# EAGLE design macropad_B (EAGLE 7.7.0)
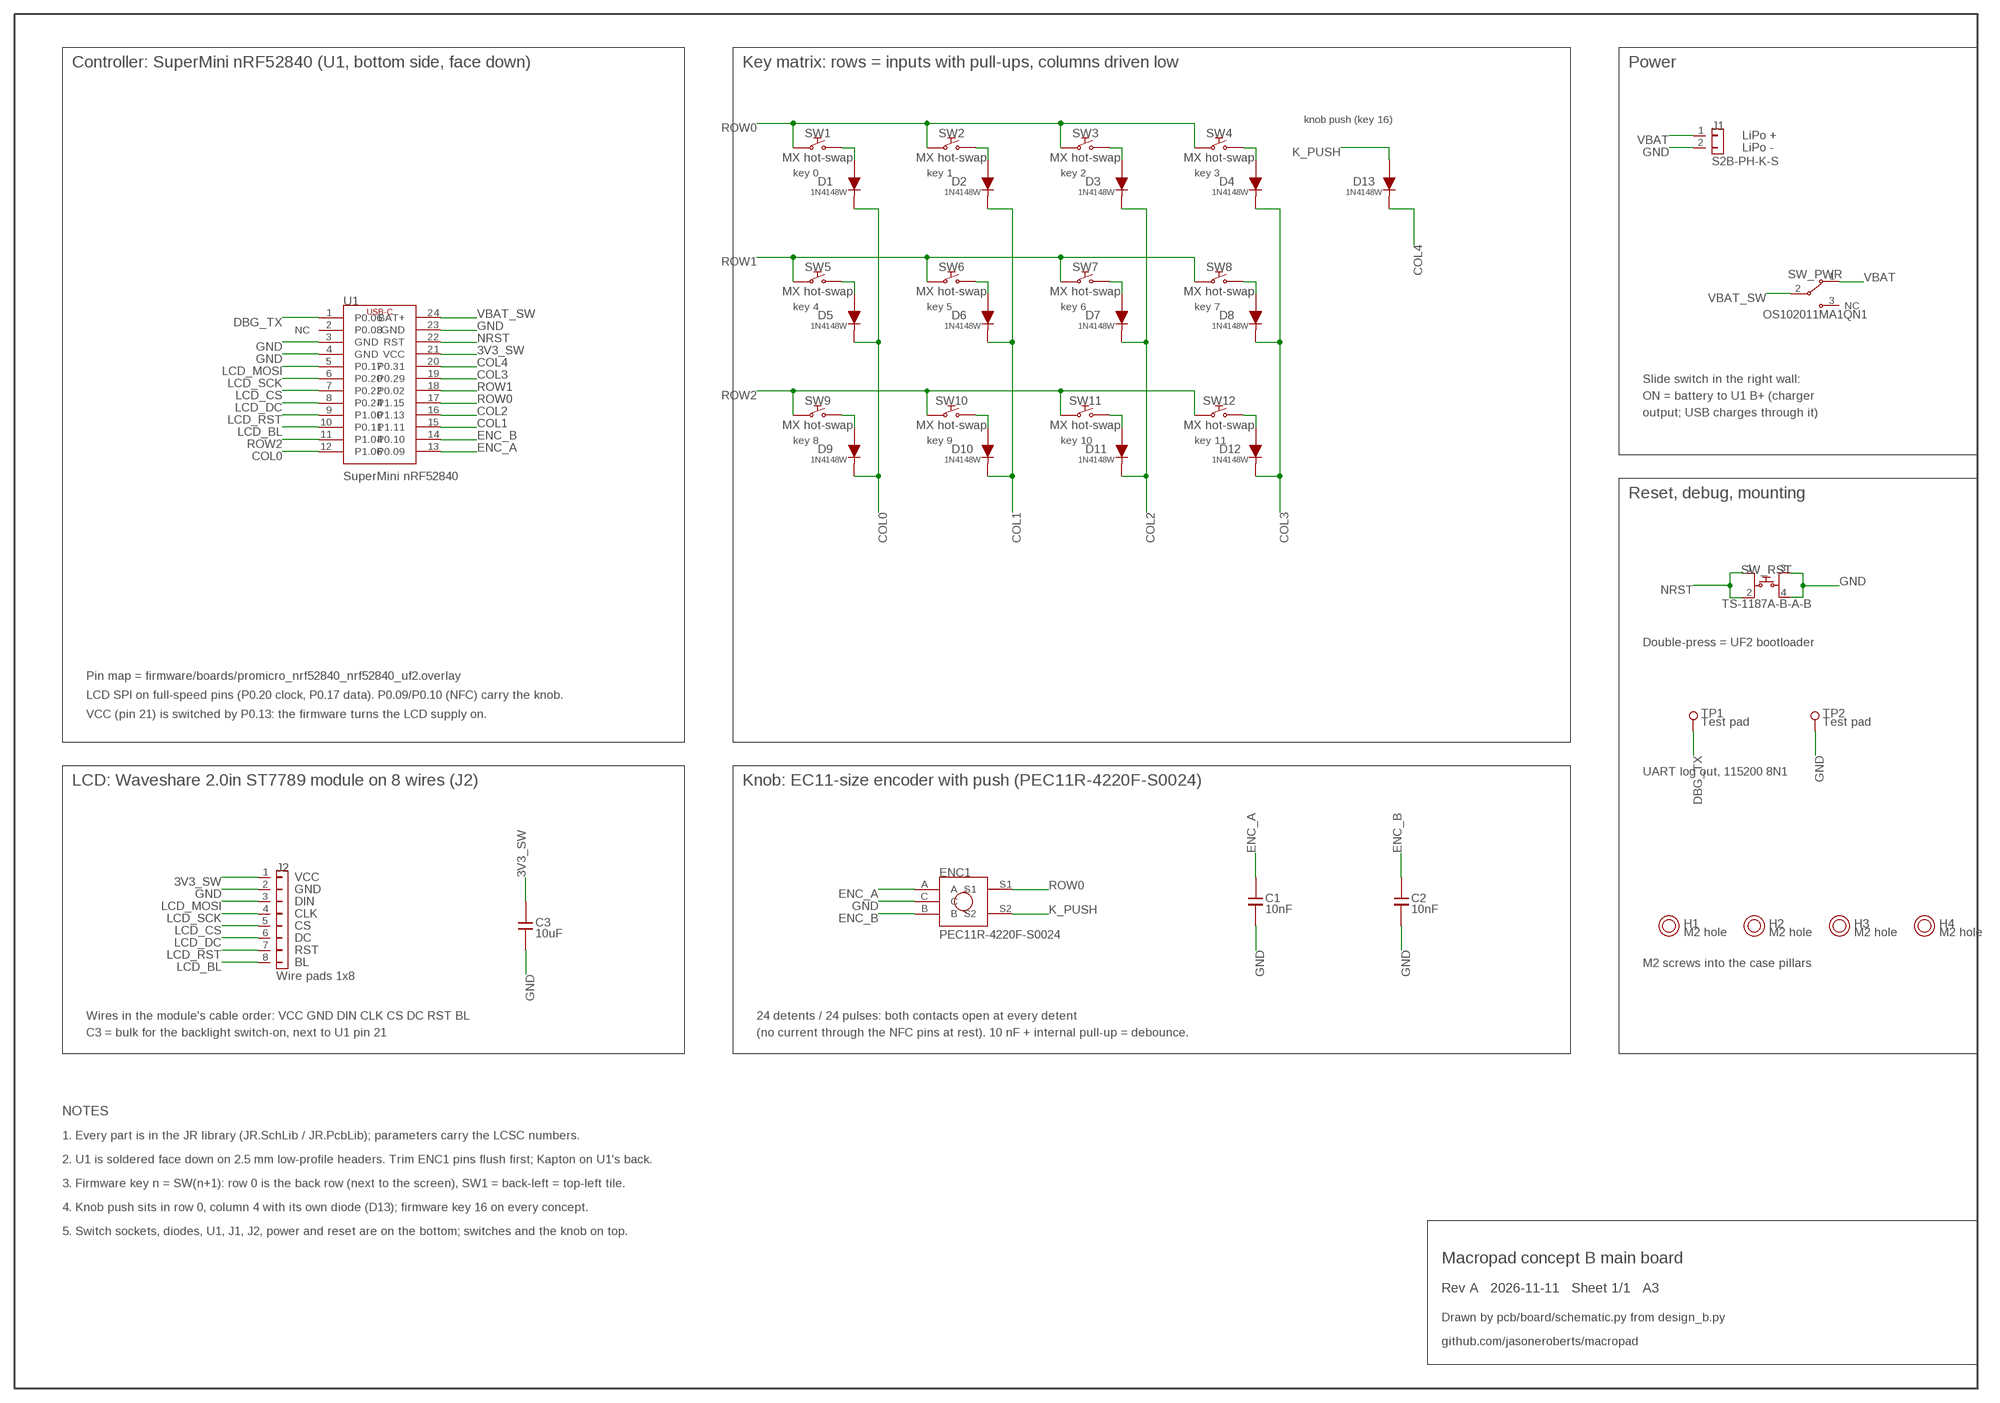
[diagram p0: schematic, sheet 1]

## Parts
C1  10nF  C_10n_0805  [C_0805_2012Metric]
C2  10nF  C_10n_0805  [C_0805_2012Metric]
C3  10uF  C_10u_0805  [C_0805_2012Metric]
D1  1N4148W  D_1N4148W_SOD-123  [D_SOD-123]
D2  1N4148W  D_1N4148W_SOD-123  [D_SOD-123]
D3  1N4148W  D_1N4148W_SOD-123  [D_SOD-123]
D4  1N4148W  D_1N4148W_SOD-123  [D_SOD-123]
D5  1N4148W  D_1N4148W_SOD-123  [D_SOD-123]
D6  1N4148W  D_1N4148W_SOD-123  [D_SOD-123]
D7  1N4148W  D_1N4148W_SOD-123  [D_SOD-123]
D8  1N4148W  D_1N4148W_SOD-123  [D_SOD-123]
D9  1N4148W  D_1N4148W_SOD-123  [D_SOD-123]
D10  1N4148W  D_1N4148W_SOD-123  [D_SOD-123]
D11  1N4148W  D_1N4148W_SOD-123  [D_SOD-123]
D12  1N4148W  D_1N4148W_SOD-123  [D_SOD-123]
D13  1N4148W  D_1N4148W_SOD-123  [D_SOD-123]
ENC1  PEC11R-4220F-S0024  Encoder_PEC11R-4220F-S0024  [RotaryEncoder_EC11_Switch_NPTH]
H1  M2 hole  MountingHole_M2  [MountingHole_2.2mm_M2]
H2  M2 hole  MountingHole_M2  [MountingHole_2.2mm_M2]
H3  M2 hole  MountingHole_M2  [MountingHole_2.2mm_M2]
H4  M2 hole  MountingHole_M2  [MountingHole_2.2mm_M2]
J1  S2B-PH-K-S  Conn_JST_PH_S2B_Horizontal  [JST_PH_S2B-PH-K_1x02_P2.00mm_Horizontal]
J2  Wire pads 1x8  Conn_Wire_Pads_1x08  [PinHeader_1x08_P2.54mm_Vertical]
SW1  MX hot-swap  SW_Kailh_MX_Hotswap  [SW_Kailh_MX_Hotswap]
SW2  MX hot-swap  SW_Kailh_MX_Hotswap  [SW_Kailh_MX_Hotswap]
SW3  MX hot-swap  SW_Kailh_MX_Hotswap  [SW_Kailh_MX_Hotswap]
SW4  MX hot-swap  SW_Kailh_MX_Hotswap  [SW_Kailh_MX_Hotswap]
SW5  MX hot-swap  SW_Kailh_MX_Hotswap  [SW_Kailh_MX_Hotswap]
SW6  MX hot-swap  SW_Kailh_MX_Hotswap  [SW_Kailh_MX_Hotswap]
SW7  MX hot-swap  SW_Kailh_MX_Hotswap  [SW_Kailh_MX_Hotswap]
SW8  MX hot-swap  SW_Kailh_MX_Hotswap  [SW_Kailh_MX_Hotswap]
SW9  MX hot-swap  SW_Kailh_MX_Hotswap  [SW_Kailh_MX_Hotswap]
SW10  MX hot-swap  SW_Kailh_MX_Hotswap  [SW_Kailh_MX_Hotswap]
SW11  MX hot-swap  SW_Kailh_MX_Hotswap  [SW_Kailh_MX_Hotswap]
SW12  MX hot-swap  SW_Kailh_MX_Hotswap  [SW_Kailh_MX_Hotswap]
SW_PWR  OS102011MA1QN1  SW_Slide_OS102011MA1QN1  [SW_Slide_SPDT_Angled_CK_OS102011MA1Q]
SW_RST  TS-1187A-B-A-B  SW_Tact_TS-1187A-B-A-B  [SW_Push_1P1T_XKB_TS-1187A]
TP1  Test pad  TestPoint_Pad_1.5mm  [TestPoint_Pad_D1.5mm]
TP2  Test pad  TestPoint_Pad_1.5mm  [TestPoint_Pad_D1.5mm]
U1  SuperMini nRF52840  SuperMini_nRF52840  [SuperMini_nRF52840]

## Nets
3V3_SW [power]: C3.1 J2.1 U1.21(VCC)
COL0: D1.1(K) D5.1(K) D9.1(K) U1.12(P1.06)
COL1: D2.1(K) D6.1(K) D10.1(K) U1.15(P1.11)
COL2: D3.1(K) D7.1(K) D11.1(K) U1.16(P1.13)
COL3: D4.1(K) D8.1(K) D12.1(K) U1.19(P0.29)
COL4: D13.1(K) U1.20(P0.31)
DBG_TX: TP1.1 U1.1(P0.06)
ENC_A: C1.1 ENC1.A U1.13(P0.09)
ENC_B: C2.1 ENC1.B U1.14(P0.10)
GND [power]: C1.2 C2.2 C3.2 ENC1.C J1.2 J2.2 SW_RST.3 SW_RST.4 TP2.1 U1.3(GND) U1.4(GND) U1.23(GND)
K1: D1.2(A) SW1.2
K2: D2.2(A) SW2.2
K3: D3.2(A) SW3.2
K4: D4.2(A) SW4.2
K5: D5.2(A) SW5.2
K6: D6.2(A) SW6.2
K7: D7.2(A) SW7.2
K8: D8.2(A) SW8.2
K9: D9.2(A) SW9.2
K10: D10.2(A) SW10.2
K11: D11.2(A) SW11.2
K12: D12.2(A) SW12.2
K_PUSH: D13.2(A) ENC1.S2
LCD_BL: J2.8 U1.10(P0.11)
LCD_CS: J2.5 U1.7(P0.22)
LCD_DC: J2.6 U1.8(P0.24)
LCD_MOSI: J2.3 U1.5(P0.17)
LCD_RST: J2.7 U1.9(P1.00)
LCD_SCK: J2.4 U1.6(P0.20)
NRST: SW_RST.1 SW_RST.2 U1.22(RST)
ROW0: ENC1.S1 SW1.1 SW2.1 SW3.1 SW4.1 U1.17(P1.15)
ROW1: SW5.1 SW6.1 SW7.1 SW8.1 U1.18(P0.02)
ROW2: SW9.1 SW10.1 SW11.1 SW12.1 U1.11(P1.04)
VBAT [power]: J1.1 SW_PWR.1
VBAT_SW [power]: SW_PWR.2(COM) U1.24(BAT+)
Unconnected: SW_PWR.3 U1.2(P0.08)

## Notes on the sheet
- Controller: SuperMini nRF52840 (U1, bottom side, face down) | Key matrix: rows = inputs with pull-ups, columns driven low | Power
- knob push (key 16)
- LiPo +
- LiPo -
- key 0 | key 1 | key 2 | key 3
- key 4 | key 5 | key 6 | key 7 | NC
- NC
- Slide switch in the right wall:
- ON = battery to U1 B+ (charger
- output; USB charges through it)
- key 8 | key 9 | key 10 | key 11
- Reset, debug, mounting
- Double-press = UF2 bootloader
- Pin map = firmware/boards/promicro_nrf52840_nrf52840_uf2.overlay
- LCD SPI on full-speed pins (P0.20 clock, P0.17 data). P0.09/P0.10 (NFC) carry the knob.
- VCC (pin 21) is switched by P0.13: the firmware turns the LCD supply on.
- UART log out, 115200 8N1
- LCD: Waveshare 2.0in ST7789 module on 8 wires (J2) | Knob: EC11-size encoder with push (PEC11R-4220F-S0024)
- VCC
- GND
- DIN
- CLK
- CS
- DC
- RST
- BL | M2 screws into the case pillars
- Wires in the module's cable order: VCC GND DIN CLK CS DC RST BL | 24 detents / 24 pulses: both contacts open at every detent
- C3 = bulk for the backlight switch-on, next to U1 pin 21 | (no current through the NFC pins at rest). 10 nF + internal pull-up = debounce.
- NOTES
- 1. Every part is in the JR library (JR.SchLib / JR.PcbLib); parameters carry the LCSC numbers.
- 2. U1 is soldered face down on 2.5 mm low-profile headers. Trim ENC1 pins flush first; Kapton on U1's back.
- 3. Firmware key n = SW(n+1): row 0 is the back row (next to the screen), SW1 = back-left = top-left tile.
- 4. Knob push sits in row 0, column 4 with its own diode (D13); firmware key 16 on every concept.
- 5. Switch sockets, diodes, U1, J1, J2, power and reset are on the bottom; switches and the knob on top.
- Macropad concept B main board
- Rev A   2026-11-11   Sheet 1/1   A3
- Drawn by pcb/board/schematic.py from design_b.py
- github.com/jasoneroberts/macropad

## Library data of the parts
C1 C2 = JR:C_10n_0805: Capacitor 10 nF 50 V X7R 0805; DESCRIPTION: Capacitor 10 nF 50 V X7R 0805; LCSC: C1710; MANUFACTURER: Samsung; MPN: CL21B103KBANNNC
C3 = JR:C_10u_0805: Capacitor 10 uF 25 V X5R 0805; DESCRIPTION: Capacitor 10 uF 25 V X5R 0805; LCSC: C15850; MANUFACTURER: Samsung; MPN: CL21A106KAYNNNE
D1-D13 = JR:D_1N4148W_SOD-123: Switching diode 100 V 150 mA, SOD-123; DESCRIPTION: Switching diode 100 V 150 mA, SOD-123; LCSC: C81598; MANUFACTURER: ST(Semtech); MPN: 1N4148W
ENC1 = JR:Encoder_PEC11R-4220F-S0024: Rotary encoder, 24 detents / 24 pulses, push switch, 20 mm flatted shaft, EC11 size; DESCRIPTION: Rotary encoder, 24 detents / 24 pulses, push switch, 20 mm flatted shaft, EC11 size; LCSC: C143797; MANUFACTURER: Bourns; MPN: PEC11R-4220F-S0024
H1-H4 = JR:MountingHole_M2: Unplated 2.2 mm hole for an M2 screw; DESCRIPTION: Unplated 2.2 mm hole for an M2 screw
J1 = JR:Conn_JST_PH_S2B_Horizontal: JST PH 2-pin header, side entry, through-hole (LiPo plug); DESCRIPTION: JST PH 2-pin header, side entry, through-hole (LiPo plug); LCSC: C173752; MANUFACTURER: JST; MPN: S2B-PH-K-S(LF)(SN)
J2 = JR:Conn_Wire_Pads_1x08: 8 plated holes, 2.54 mm, 1.0 mm drill: solder wires (or a 1x8 header); DESCRIPTION: 8 plated holes, 2.54 mm, 1.0 mm drill: solder wires (or a 1x8 header)
SW1-SW12 = JR:SW_Kailh_MX_Hotswap: Kailh MX hot-swap socket for MX switches. Footprint goes on the bottom layer; DESCRIPTION: Kailh MX hot-swap socket for MX switches. Footprint goes on the bottom layer; LCSC: C2803348; MANUFACTURER: Kailh; MPN: CPG151101S11
SW_PWR = JR:SW_Slide_OS102011MA1QN1: Slide switch SPDT, right angle, through-hole, 4 mm actuator; DESCRIPTION: Slide switch SPDT, right angle, through-hole, 4 mm actuator; LCSC: C226259; MANUFACTURER: C&K; MPN: OS102011MA1QN1
SW_RST = JR:SW_Tact_TS-1187A-B-A-B: Tactile switch 5.1 x 5.1 x 1.5 mm, SMD gull-wing, 160 gf; DESCRIPTION: Tactile switch 5.1 x 5.1 x 1.5 mm, SMD gull-wing, 160 gf; LCSC: C318884; MANUFACTURER: XKB Connection; MPN: TS-1187A-B-A-B
TP1 TP2 = JR:TestPoint_Pad_1.5mm: Test pad, 1.5 mm, no part fitted; DESCRIPTION: Test pad, 1.5 mm, no part fitted
U1 = JR:SuperMini_nRF52840: nRF52840 module, nice!nano v2 pinout, LiPo charger, USB-C. Pro Micro 24-pin; DESCRIPTION: nRF52840 module, nice!nano v2 pinout, LiPo charger, USB-C. Pro Micro 24-pin; MANUFACTURER: generic (nice!nano v2 clone); MPN: SuperMini nRF52840

## Net classes
0 default: width 0.25 mm, drill 0.3 mm, clearance 0.2 mm
1 power: width 0.4 mm, drill 0.3 mm, clearance 0.2 mm

## Board
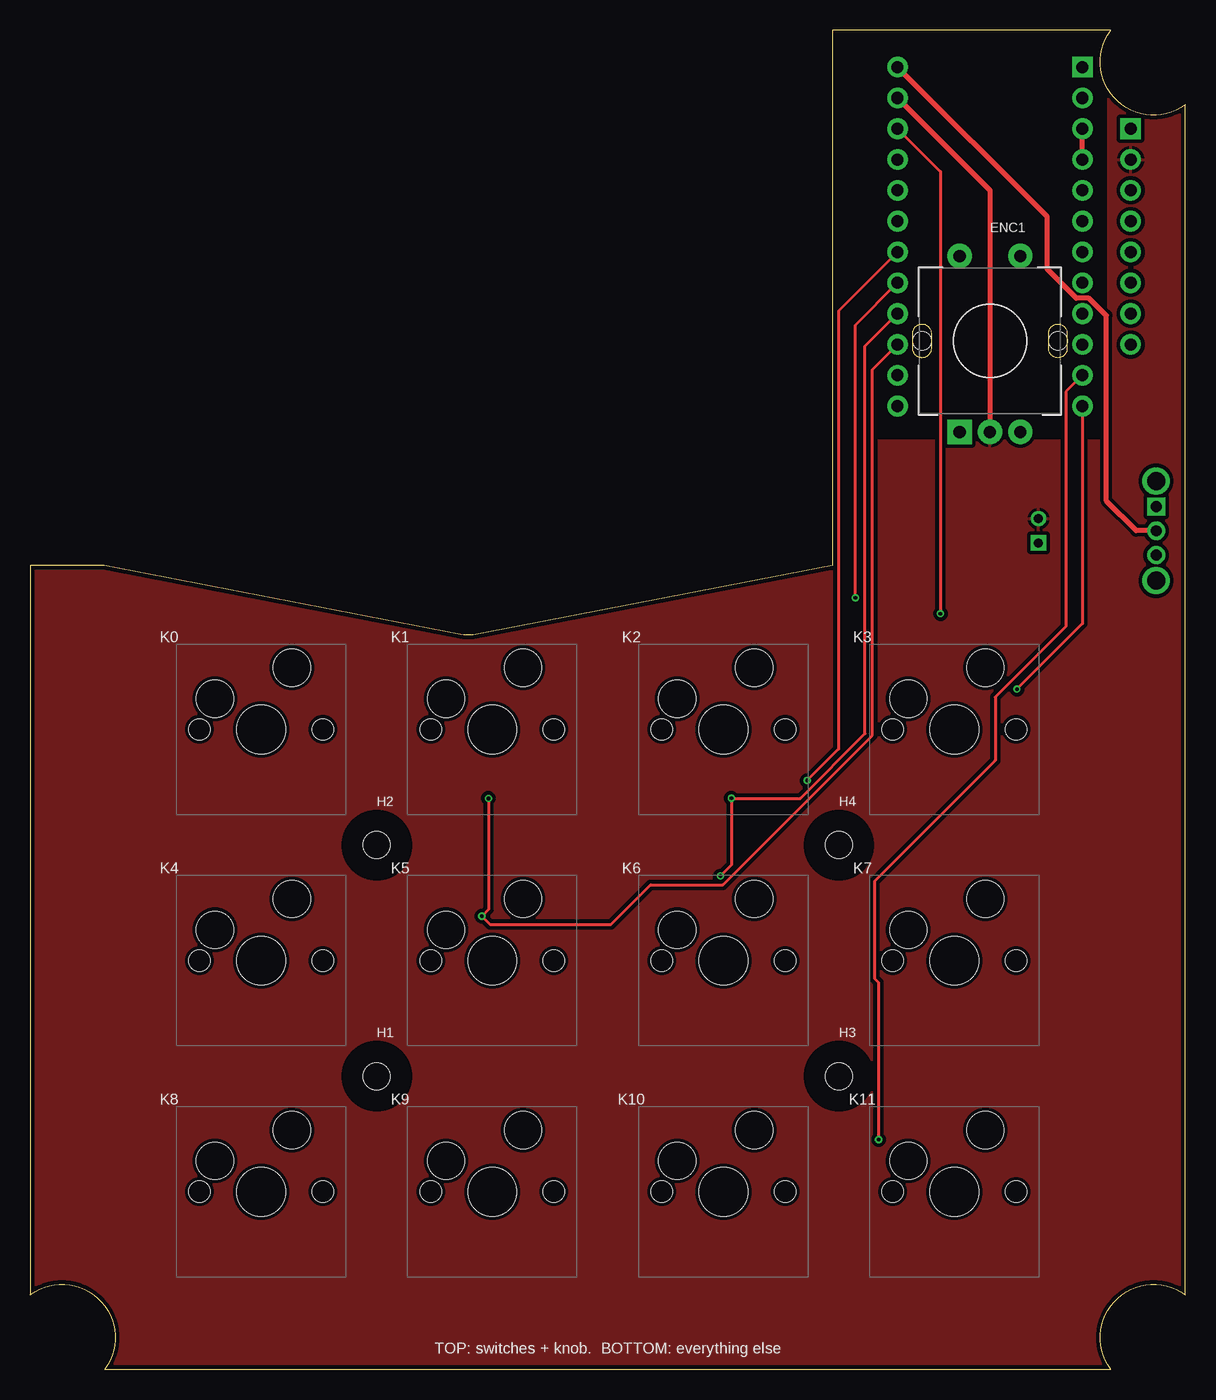
[diagram p1: board, top side]
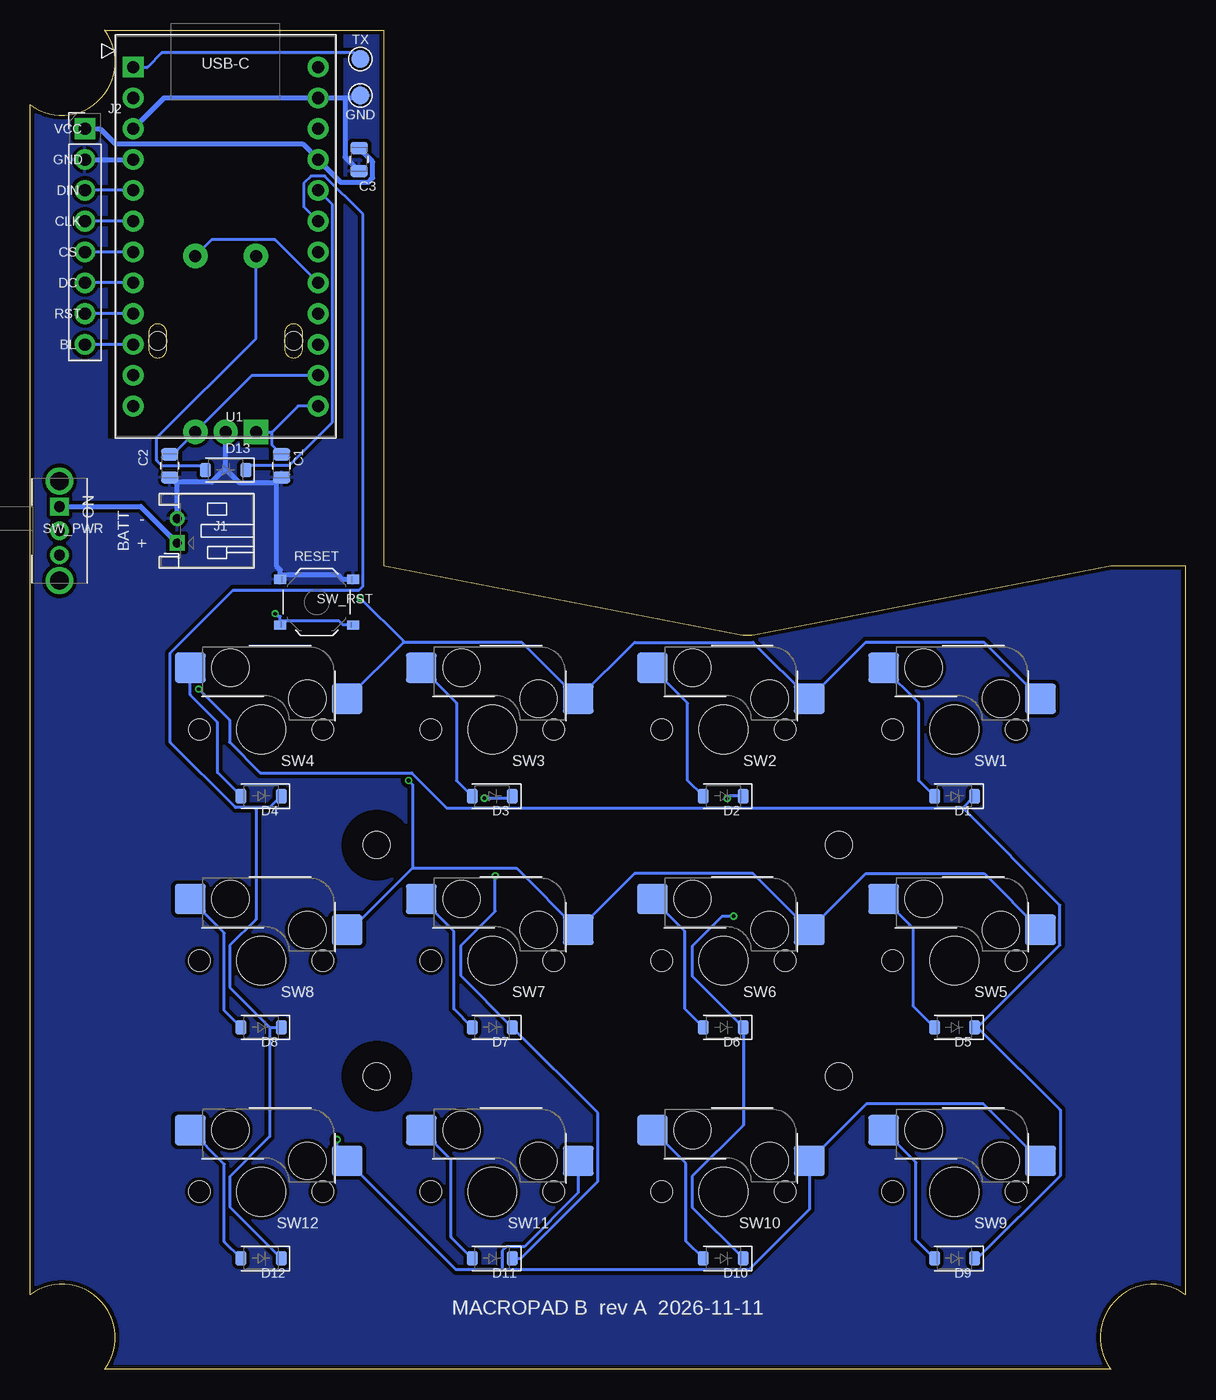
[diagram p2: board, bottom side, seen from below]

Size 95.2 x 110.35 mm. Coordinates in mm from the lower left corner, seen from the top.
Outline: 89.05,110.35 66.1,110.35 66.1,66.25 36.72,60.56 arc-22 35.48,60.56 6.1,66.25 0,66.25 0,6.15 arc-162 6.15,0 89.05,0 arc-162 95.2,6.15 95.2,104.2 arc-162 89.05,110.35
Copper layers (1*16): Top / Bottom
Design rules "macropad": minimum track width 0.2mm, minimum drill 0.3mm, track to track 0.2mm, track to pad 0.2mm, pad to pad 0.2mm, via to via 0.2mm, copper to edge 0.3mm, drill to drill 0.25mm, minimum via ring 0.15mm
tRestrict: area 26.7,22.3 to 30.5,26.1; area 26.7,41.3 to 30.5,45.1; area 64.7,22.3 to 68.5,26.1; area 64.7,41.3 to 68.5,45.1
bRestrict: area 26.7,22.3 to 30.5,26.1; area 26.7,41.3 to 30.5,45.1; area 64.7,22.3 to 68.5,26.1; area 64.7,41.3 to 68.5,45.1

### Footprints (pad centres in the part's own frame; a part is rotated, then mirrored left to right if it is on the bottom)
C_0805_2012Metric = smd 1 x 1.45: 1 -0.95,0; 2 0.95,0
D_SOD-123 = smd 0.9 x 1.2: 1 -1.65,0; 2 1.65,0
RotaryEncoder_EC11_Switch_NPTH = drill 1 pad 2 square: A -7.5,2.5 | drill 1 pad 2 round: B -7.5,-2.5; C -7.5,0; S1 7,-2.5; S2 7,2.5 | hole 1.5: 0,5.6; 0,-5.6
MountingHole_2.2mm_M2 = hole 2.2: 0,0
JST_PH_S2B-PH-K_1x02_P2.00mm_Horizontal = drill 0.75 pad 1.2 square: 1 0,0 | drill 0.75 pad 1.2 round: 2 2,0
PinHeader_1x08_P2.54mm_Vertical = drill 1 pad 1.7 square: 1 0,0 | drill 1 pad 1.7 round: 2 0,-2.54; 3 0,-5.08; 4 0,-7.62; 5 0,-10.16; 6 0,-12.7; 7 0,-15.24; 8 0,-17.78
SW_Kailh_MX_Hotswap = smd 2.55 x 2.5: 1 7.085,2.54; 2 -5.842,5.08 | hole 4: 0,0 | hole 1.75: -5.08,0; 5.08,0 | hole 3.05: 3.81,2.54; -2.54,5.08
SW_Slide_SPDT_Angled_CK_OS102011MA1Q = drill 0.9 pad 1.5 square: 1 0,0 | drill 0.9 pad 1.5 round: 2 2,0; 3 4,0 | drill 1.5 pad 2.2 round: MP1 -2.1,0; MP2 6.1,0
SW_Push_1P1T_XKB_TS-1187A = smd 1 x 0.75: 1 -3,1.875; 2 3,1.875; 3 -3,-1.875; 4 3,-1.875
TestPoint_Pad_D1.5mm = smd 1.5 x 1.5: 1 0,0
SuperMini_nRF52840 = drill 1 pad 1.7 square: 1 -7.62,13.97 | drill 1 pad 1.7 round: 2 -7.62,11.43; 3 -7.62,8.89; 4 -7.62,6.35; 5 -7.62,3.81; 6 -7.62,1.27; 7 -7.62,-1.27; 8 -7.62,-3.81; 9 -7.62,-6.35; 10 -7.62,-8.89; 11 -7.62,-11.43; 12 -7.62,-13.97; 13 7.62,-13.97; 14 7.62,-11.43; 15 7.62,-8.89; 16 7.62,-6.35; 17 7.62,-3.81; 18 7.62,-1.27; 19 7.62,1.27; 20 7.62,3.81; 21 7.62,6.35; 22 7.62,8.89; 23 7.62,11.43; 24 7.62,13.97

### Placement (x,y rotation side)
C1  74.5,74.45 270 bottom
C2  83.7,74.45 270 bottom
C3  68.1,99.7 270 bottom
D1  19.03,47.23 180 bottom
D2  38.08,47.23 180 bottom
D3  57.12,47.23 180 bottom
D4  76.17,47.23 180 bottom
D5  19.03,28.18 180 bottom
D6  38.08,28.18 180 bottom
D7  57.12,28.18 180 bottom
D8  76.17,28.18 180 bottom
D9  19.03,9.12 180 bottom
D10  38.08,9.12 180 bottom
D11  57.12,9.12 180 bottom
D12  76.17,9.12 180 bottom
D13  79.1,74.1 180 bottom
ENC1  79.1,84.75 90 top
H1  28.55,24.15 0 top
H2  28.55,43.2 0 top
H3  66.65,24.15 0 top
H4  66.65,43.2 0 top
J1  83.1,68.1 90 bottom
J2  90.7,102.24 0 bottom
SW1  19.03,52.73 0 bottom
SW2  38.08,52.73 0 bottom
SW3  57.12,52.73 0 bottom
SW4  76.17,52.73 0 bottom
SW5  19.03,33.68 0 bottom
SW6  38.08,33.68 0 bottom
SW7  57.12,33.68 0 bottom
SW8  76.17,33.68 0 bottom
SW9  19.03,14.62 0 bottom
SW10  38.08,14.62 0 bottom
SW11  57.12,14.62 0 bottom
SW12  76.17,14.62 0 bottom
SW_PWR  92.8,71.1 270 bottom
SW_RST  71.6,63.23 180 bottom
TP1  68,108 0 bottom
TP2  68,105 0 bottom
U1  79.1,93.35 0 bottom

### Tracks (layer width: path | path; a pad name or v marks a point on that pad's centre or on a via)
3V3_SW
  Bottom 0.4: C3.1 66.97,99.52 66.97,98.19 67.33,97.83 69.61,97.83 U1.21 72.77,100.99 88.2,100.99 89.45,102.24 J2.1
COL0  (via drill 0.3 pad 0.6)
  Top 0.25: v81.32,56.05 86.72,61.45 U1.12
  Bottom 0.25: 18.35,46.25 10.33,38.24 10.33,34.96 17.12,28.18 | 17.12,28.18 10.31,21.36 10.31,15.94 17.12,9.12 D9.1 | 18.35,46.25 60.88,46.25 63.77,49.15 76.24,49.15 78.77,51.68 78.77,53.5 v81.32,56.05 | D5.1 17.12,28.18 | 18.35,46.25 D1.1
COL1  (via drill 0.3 pad 0.6)
  Top 0.25: v37.77,47.04 37.77,37.89 v37.21,37.33 37.91,36.64 47.85,36.64 51.14,39.93 57.08,39.93 69.39,52.25 69.39,82.38 U1.15
  Bottom 0.25: v37.77,47.04 37.58,47.23 D2.1 | D10.1 40.65,13.35 40.65,15.87 36.43,20.1 D6.1 40.66,32.41 40.66,34.85 38.18,37.33 v37.21,37.33
COL2  (via drill 0.3 pad 0.6)
  Top 0.25: U1.16 68.8,84.32 68.8,52.39 63.47,47.06 v57.79,47.06 57.79,41.55 v56.88,40.65
  Bottom 0.25: v57.79,47.06 55.64,47.06 D3.1 | D11.1 54.77,9.12 48.42,15.47 48.42,21.12 D7.1 59.72,32.42 59.72,34.91 56.88,37.74 v56.88,40.65
COL3
  Bottom 0.25: 75.46,28.18 75.46,19.17 78.76,15.86 78.76,13.36 D12.1 | U1.19 72.66,95.8 72.66,97.74 72.06,98.34 70.93,98.34 67.77,95.18 67.77,64.54 68.11,64.21 78.49,64.21 83.65,59.04 83.65,51.66 78.29,46.29 76.59,46.29 | 75.46,28.18 78.76,31.48 78.76,34.91 76.59,37.09 76.59,46.29 | 75.46,28.18 D8.1 | D4.1 75.46,46.29 76.59,46.29
COL4
  Bottom 0.25: D13.1 77.01,74.54 73.81,74.54 70.29,78.06 70.29,95.97 U1.20
DBG_TX
  Bottom 0.25: TP1.1 68.5,108.5 84.37,108.5 85.54,107.32 U1.1
ENC_A
  Bottom 0.25: C1.1 75.27,76.17 75.27,77.25 | U1.13 73.14,79.38 75.27,77.25 | ENC1.A 75.27,77.25
ENC_B
  Bottom 0.25: C2.1 83.45,75.4 ENC1.B 76.93,81.92 U1.14
GND
  Top 0.4: ENC1.C 79.1,97.16 U1.23 | U1.4 U1.3
  Bottom 0.4: 79.13,74.21 80.24,73.1 83.1,73.1 | 74.92,73.08 78,73.08 79.13,74.21 | 83.1,73.1 83.1,71.1 J1.2 | 69.26,104.78 69.26,99.91 C3.2 | 74.6,65.49 69.89,65.49 69.5,65.1 SW_RST.3 | 69.26,104.78 U1.23 84.18,104.78 U1.3 | 74.6,65.49 74.6,65.88 74.92,66.2 74.92,73.08 | C2.2 83.3,73.1 83.1,73.1 | J2.2 U1.4 | 74.92,73.08 C1.2 | SW_RST.4 74.6,65.49 | TP2.1 68.22,104.78 69.26,104.78 | ENC1.C 79.13,77.22 79.13,74.21
  pour Top (isolate 0.3): 0.3,65.95 6.07,65.95 35.43,60.26 35.81,60.21 36.2,60.2 36.77,60.26 66.4,66 66.4,110.05 69.3,110.05 69.3,76.55 88.9,76.55 88.9,104.85 89.46,104.26 90.04,103.81 90.69,103.45 91.15,103.28 91.63,103.15 92.36,103.06 92.86,103.06 93.35,103.11 94.07,103.28 94.53,103.46 94.9,103.65 94.9,6.7 94.53,6.89 94.07,7.07 93.35,7.24 92.61,7.3 91.87,7.24 91.15,7.07 90.47,6.79 89.84,6.4 89.28,5.92 88.8,5.36 88.41,4.73 88.13,4.05 87.96,3.33 87.9,2.59 87.96,1.85 88.13,1.13 88.31,0.67 88.5,0.3 6.7,0.3 6.89,0.67 7.07,1.13 7.24,1.85 7.3,2.59 7.24,3.33 7.07,4.05 6.79,4.73 6.4,5.36 5.92,5.92 5.36,6.4 4.73,6.79 4.05,7.07 3.33,7.24 2.59,7.3 1.85,7.24 1.13,7.07 0.67,6.89 0.3,6.7
  pour Bottom (isolate 0.3): 0.3,65.95 6.07,65.95 35.43,60.26 35.81,60.21 36.2,60.2 36.77,60.26 66.4,66 66.4,110.05 69.3,110.05 69.3,76.55 88.9,76.55 88.9,104.85 89.46,104.26 90.04,103.81 90.69,103.45 91.15,103.28 91.63,103.15 92.36,103.06 92.86,103.06 93.35,103.11 94.07,103.28 94.53,103.46 94.9,103.65 94.9,6.7 94.53,6.89 94.07,7.07 93.35,7.24 92.61,7.3 91.87,7.24 91.15,7.07 90.47,6.79 89.84,6.4 89.28,5.92 88.8,5.36 88.41,4.73 88.13,4.05 87.96,3.33 87.9,2.59 87.96,1.85 88.13,1.13 88.31,0.67 88.5,0.3 6.7,0.3 6.89,0.67 7.07,1.13 7.24,1.85 7.3,2.59 7.24,3.33 7.07,4.05 6.79,4.73 6.4,5.36 5.92,5.92 5.36,6.4 4.73,6.79 4.05,7.07 3.33,7.24 2.59,7.3 1.85,7.24 1.13,7.07 0.67,6.89 0.3,6.7
K1
  Bottom 0.25: D1.2 21.97,48.52 21.97,54.91 SW1.2
K2
  Bottom 0.25: SW2.2 41.02,54.91 41.02,48.52 D2.2
K3
  Bottom 0.25: SW3.2 60.07,54.91 60.07,48.52 D3.2
K4
  Bottom 0.25: SW4.2 82.02,55.57 79.76,53.32 79.76,49.16 D4.2
K5
  Bottom 0.25: D5.2 22.42,29.92 22.42,36.31 SW5.2
K6
  Bottom 0.25: SW6.2 41.25,36.08 41.25,29.7 D6.2
K7
  Bottom 0.25: D7.2 60.28,29.68 60.28,36.07 SW7.2
K8
  Bottom 0.25: D8.2 79.21,29.56 79.21,35.95 SW8.2
K9
  Bottom 0.25: SW9.2 22.2,17.04 22.2,10.65 D9.2
K10
  Bottom 0.25: SW10.2 41.16,16.95 41.16,10.56 D10.2
K11
  Bottom 0.25: D11.2 60.52,10.87 60.52,17.26 SW11.2
K12
  Bottom 0.25: D12.2 79.21,10.51 79.21,16.9 SW12.2
K_PUSH
  Bottom 0.25: ENC1.S2 76.6,84.96 84.78,76.78 84.78,74.9 84.33,74.45 81.1,74.45 D13.2
LCD_BL
  Bottom 0.25: U1.10 J2.8
LCD_CS
  Bottom 0.25: U1.7 J2.5
LCD_DC
  Bottom 0.25: U1.8 J2.6
LCD_MOSI
  Bottom 0.25: U1.5 J2.3
LCD_RST
  Bottom 0.25: U1.9 J2.7
LCD_SCK
  Bottom 0.25: U1.6 J2.4
NRST  (via drill 0.3 pad 0.6)
  Top 0.25: U1.22 75.02,98.7 v75.02,62.27
  Bottom 0.25: v75.02,62.27 74.79,62.05 74.6,62.05 74.6,61.7 | 74.6,61.7 69.78,61.7 69.43,61.35 SW_RST.1 | SW_RST.2 74.6,61.7
ROW0  (via drill 0.3 pad 0.6)
  Top 0.25: v68.01,63.57 68.01,86.07 U1.17
  Bottom 0.25: ENC1.S1 80.26,93.09 75.03,93.09 U1.17 | 64.44,59.91 SW4.1 | 64.44,59.91 54.69,59.91 SW3.1 45.4,59.91 35.63,59.91 SW2.1 26.34,59.91 16.59,59.91 SW1.1 | v68.01,63.57 64.44,60 64.44,59.91
ROW1  (via drill 0.3 pad 0.6)
  Top 0.25: v64.03,48.52 66.62,51.12 66.62,87.22 U1.18
  Bottom 0.25: SW5.1 16.58,40.86 26.35,40.86 SW6.1 35.63,40.86 45.4,40.86 SW7.1 55.13,41.31 63.7,41.31 | 63.7,41.31 63.7,48.19 v64.03,48.52 | 63.7,41.31 68.79,36.22 SW8.1
ROW2  (via drill 0.3 pad 0.6)
  Top 0.25: v69.92,18.93 69.92,31.86 69.57,32.2 69.57,40.22 79.53,50.18 79.53,55.4 85.35,61.22 85.35,80.55 U1.11
  Bottom 0.25: 56.3,8.19 56.3,9.74 55.94,10.1 54.48,10.1 50.04,14.54 SW11.1 | v69.92,18.93 69.92,17.99 SW12.1 60.12,8.19 56.3,8.19 | 56.3,8.19 35.96,8.19 30.99,13.16 SW10.1 26.3,21.85 16.63,21.85 SW9.1
VBAT
  Bottom 0.4: J1.1 86.1,71.1 SW_PWR.1
VBAT_SW
  Top 0.4: SW_PWR.2 91.15,69.1 88.69,71.56 88.69,86.84 87.26,88.27 86.21,88.27 83.81,90.67 83.81,94.99 U1.24

### Text on the board
tPlace: K0 | K1 | K2 | K3 | K4 | K5 | K6 | K7 | K8 | K9 | K10 | K11 | TOP: switches + knob. BOTTOM: everything else
bPlace: TX | USB-C | GND | VCC | GND | DIN | CLK | CS | DC | RST | BL | ON | - | BATT | + | RESET | SW1 | SW2 | SW3 | SW4 | SW5 | SW6 | SW7 | SW8 | SW9 | SW10 | SW11 | SW12 | MACROPAD B rev A 2026-11-11
Document: Display opening: module sits here
bDocu: U1: SuperMini nRF52840, parts facing the board